# Altium schematic sheet Main.SchDoc
size B; SheetNumber: 1; SheetTotal: 1
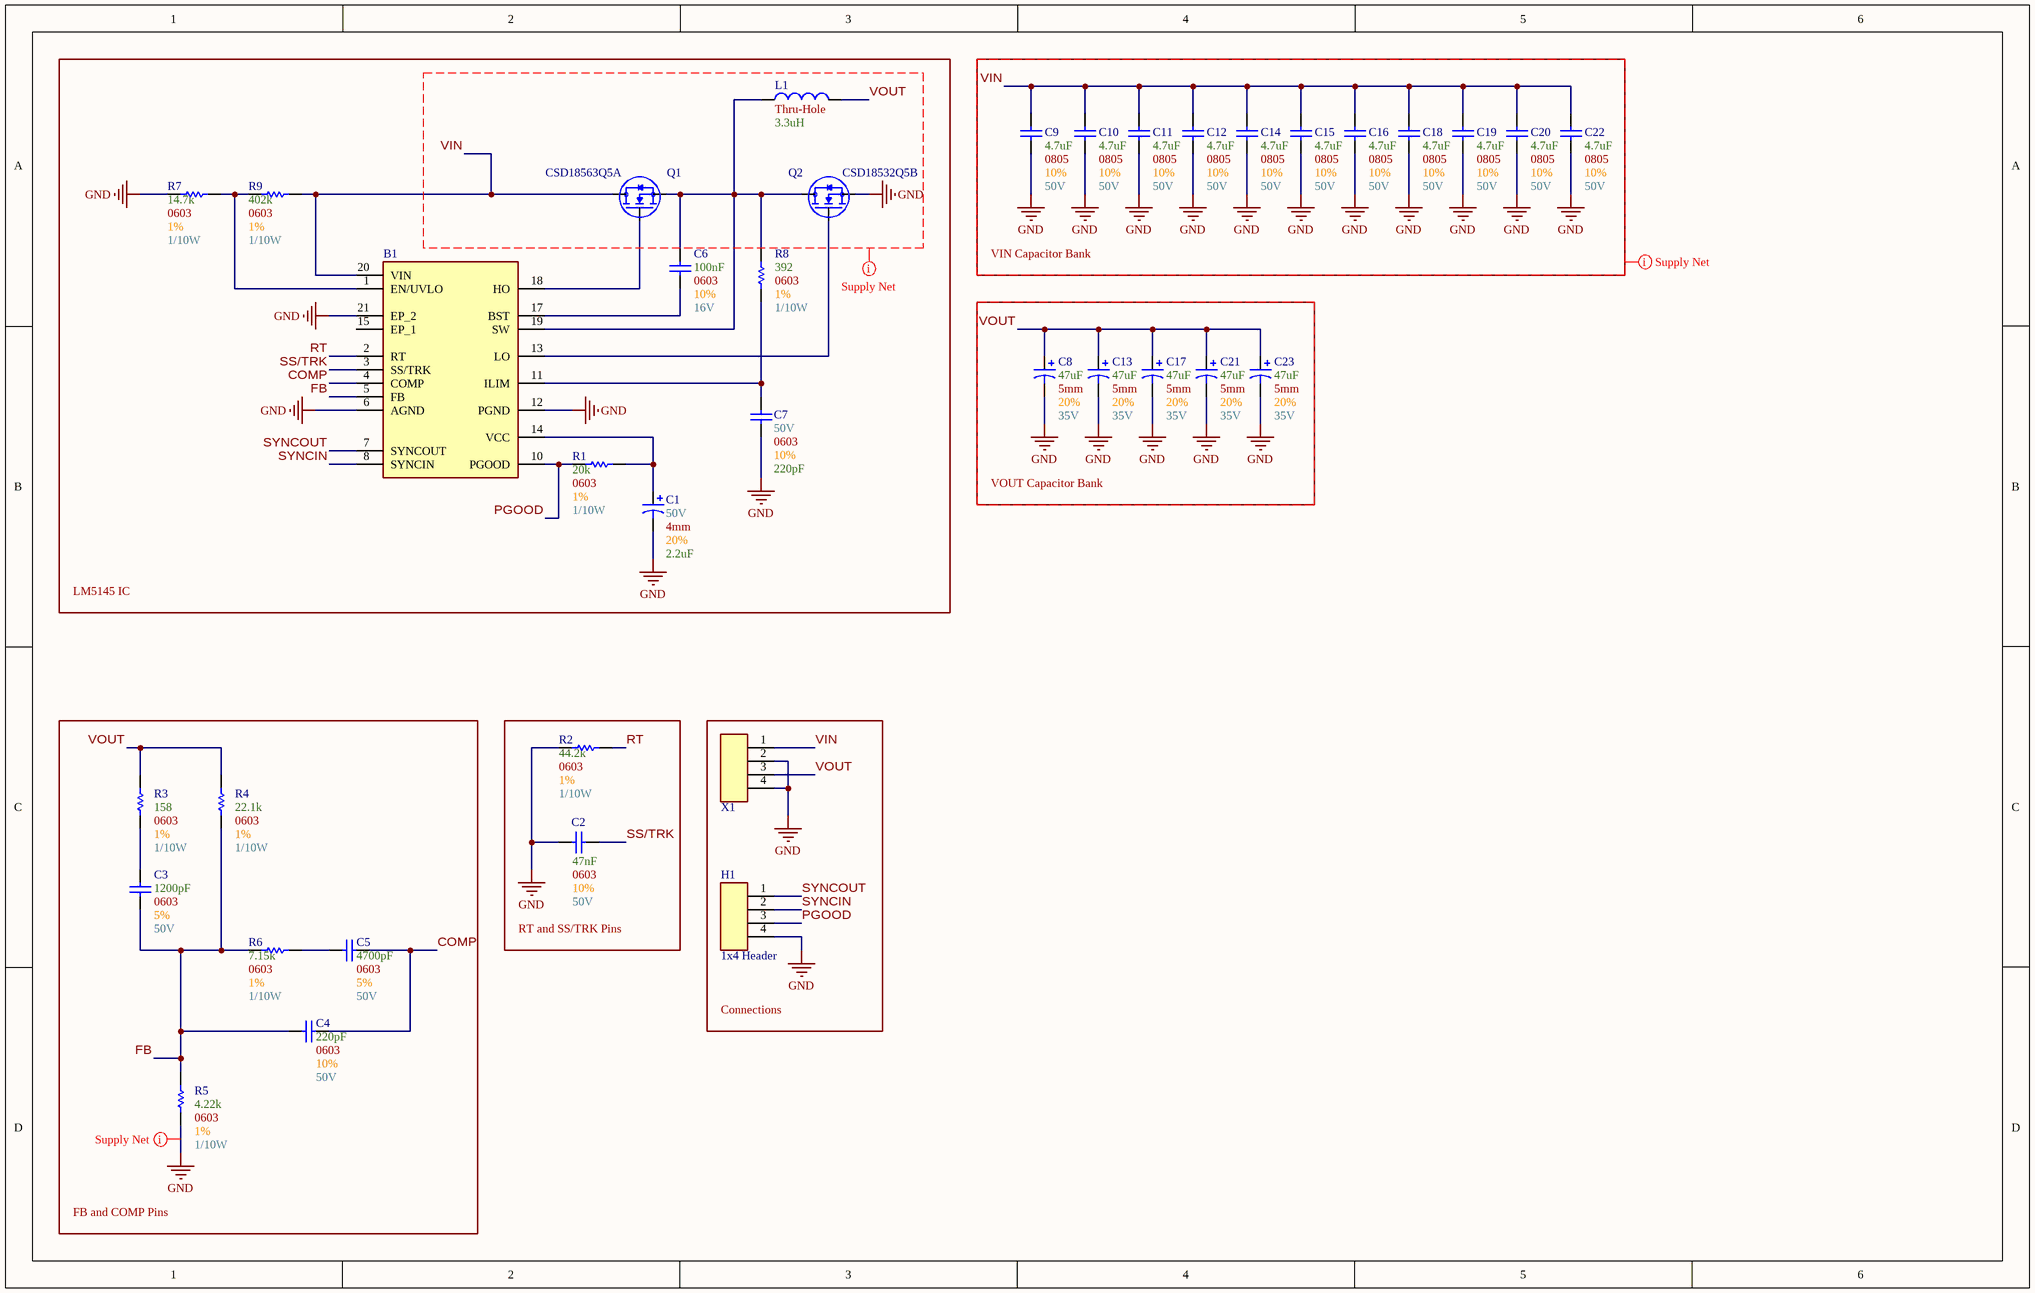
[diagram p0: Main.SchDoc]

## Parts
B1  [Buck Controller] 6-75V Buck Controller  [[Buck Controller] 6-75V Buck Controller]  (value not drawn)
C1  Max Voltage: 50V  Size Package: 4mm  Tolerance: 20%  Capacitance: 2.2uF  [[Cap] SMD Polarized, 4mm]  (hidden comment: [Cap] 4mm 2.2uF 20% 50V)
C2  Max Voltage: 50V  Size Package: 0603  Tolerance: 10%  Capacitance: 47nF  [[Cap] SMD 0603]  (hidden comment: [Cap] 0603 47nF 10% 50V)
C3  Max Voltage: 50V  Size Package: 0603  Tolerance: 5%  Capacitance: 1200pF  [[Cap] SMD 0603]  (hidden comment: [Cap] 0603 1200pF 5% 50V)
C4  Max Voltage: 50V  Size Package: 0603  Tolerance: 10%  Capacitance: 220pF  [[Cap] SMD 0603]  (hidden comment: [Cap] 0603 220pF 10% 50V)
C5  Max Voltage: 50V  Size Package: 0603  Tolerance: 5%  Capacitance: 4700pF  [[Cap] SMD 0603]  (hidden comment: [Cap] 0603 4700pF 5% 50V)
C6  Max Voltage: 16V  Size Package: 0603  Tolerance: 10%  Capacitance: 100nF  [[Cap] SMD 0603]  (hidden comment: [Cap] 0603 0.1uF 10% 16V)
C7  Max Voltage: 50V  Size Package: 0603  Tolerance: 10%  Capacitance: 220pF  [[Cap] SMD 0603]  (hidden comment: [Cap] 0603 12pF 5% 50V)
C8  Max Voltage: 35V  Size Package: 5mm  Tolerance: 20%  Capacitance: 47uF  [[Cap] SMD Polarized, 5mm]  (hidden comment: [Cap] 5mm 47uF 20% 35V)
C9  Max Voltage: 50V  Size Package: 0805  Tolerance: 10%  Capacitance: 4.7uF  [[Cap] SMD 0805]  (hidden comment: [Cap] 0805 4.7uF 10% 50V)
C10  Max Voltage: 50V  Size Package: 0805  Tolerance: 10%  Capacitance: 4.7uF  [[Cap] SMD 0805]  (hidden comment: [Cap] 0805 4.7uF 10% 50V)
C11  Max Voltage: 50V  Size Package: 0805  Tolerance: 10%  Capacitance: 4.7uF  [[Cap] SMD 0805]  (hidden comment: [Cap] 0805 4.7uF 10% 50V)
C12  Max Voltage: 50V  Size Package: 0805  Tolerance: 10%  Capacitance: 4.7uF  [[Cap] SMD 0805]  (hidden comment: [Cap] 0805 4.7uF 10% 50V)
C13  Max Voltage: 35V  Size Package: 5mm  Tolerance: 20%  Capacitance: 47uF  [[Cap] SMD Polarized, 5mm]  (hidden comment: [Cap] 5mm 47uF 20% 35V)
C14  Max Voltage: 50V  Size Package: 0805  Tolerance: 10%  Capacitance: 4.7uF  [[Cap] SMD 0805]  (hidden comment: [Cap] 0805 4.7uF 10% 50V)
C15  Max Voltage: 50V  Size Package: 0805  Tolerance: 10%  Capacitance: 4.7uF  [[Cap] SMD 0805]  (hidden comment: [Cap] 0805 4.7uF 10% 50V)
C16  Max Voltage: 50V  Size Package: 0805  Tolerance: 10%  Capacitance: 4.7uF  [[Cap] SMD 0805]  (hidden comment: [Cap] 0805 4.7uF 10% 50V)
C17  Max Voltage: 35V  Size Package: 5mm  Tolerance: 20%  Capacitance: 47uF  [[Cap] SMD Polarized, 5mm]  (hidden comment: [Cap] 5mm 47uF 20% 35V)
C18  Max Voltage: 50V  Size Package: 0805  Tolerance: 10%  Capacitance: 4.7uF  [[Cap] SMD 0805]  (hidden comment: [Cap] 0805 4.7uF 10% 50V)
C19  Max Voltage: 50V  Size Package: 0805  Tolerance: 10%  Capacitance: 4.7uF  [[Cap] SMD 0805]  (hidden comment: [Cap] 0805 4.7uF 10% 50V)
C20  Max Voltage: 50V  Size Package: 0805  Tolerance: 10%  Capacitance: 4.7uF  [[Cap] SMD 0805]  (hidden comment: [Cap] 0805 4.7uF 10% 50V)
C21  Max Voltage: 35V  Size Package: 5mm  Tolerance: 20%  Capacitance: 47uF  [[Cap] SMD Polarized, 5mm]  (hidden comment: [Cap] 5mm 47uF 20% 35V)
C22  Max Voltage: 50V  Size Package: 0805  Tolerance: 10%  Capacitance: 4.7uF  [[Cap] SMD 0805]  (hidden comment: [Cap] 0805 4.7uF 10% 50V)
C23  Max Voltage: 35V  Size Package: 5mm  Tolerance: 20%  Capacitance: 47uF  [[Cap] SMD Polarized, 5mm]  (hidden comment: [Cap] 5mm 47uF 20% 35V)
H1  1x4 Header  [[Header] 1x4 Male]
L1  Package: Thru-Hole  Inductance: 3.3uH  [[Inductor] 19.18mm Diameter]  (hidden comment: [3.3uH] Thru-Hole 40A 2.4mOhm)
Q1  CSD18563Q5A  [8-VSON]
Q2  CSD18532Q5B  [8-VSON]
R1  Wattage: 1/10W  Tolerance: 1%  Resistance: 20k  Size Package: 0603  [[Res] SMD 0603]  (hidden comment: [20k] SMD 0603 1% 1/10W)
R2  Wattage: 1/10W  Tolerance: 1%  Resistance: 44.2k  Size Package: 0603  [[Res] SMD 0603]  (hidden comment: [44.2k] SMD 0603 1% 1/10W)
R3  Wattage: 1/10W  Tolerance: 1%  Resistance: 158  Size Package: 0603  [[Res] SMD 0603]  (hidden comment: [158] SMD 0603 1% 1/10W)
R4  Wattage: 1/10W  Tolerance: 1%  Resistance: 22.1k  Size Package: 0603  [[Res] SMD 0603]  (hidden comment: [22.1k] SMD 0603 1% 1/10W)
R5  Wattage: 1/10W  Tolerance: 1%  Resistance: 4.22k  Size Package: 0603  [[Res] SMD 0603]  (hidden comment: [4.22k] SMD 0603 1% 1/10W)
R6  Wattage: 1/10W  Tolerance: 1%  Resistance: 7.15k  Size Package: 0603  [[Res] SMD 0603]  (hidden comment: [7.15k] SMD 0603 1% 1/10W)
R7  Wattage: 1/10W  Tolerance: 1%  Resistance: 14.7k  Size Package: 0603  [[Res] SMD 0603]  (hidden comment: [14.7k] SMD 0603 1% 1/10W)
R8  Wattage: 1/10W  Tolerance: 1%  Resistance: 392  Size Package: 0603  [[Res] SMD 0603]  (hidden comment: [392] SMD 0603 1% 1/10W)
R9  Wattage: 1/10W  Tolerance: 1%  Resistance: 402k  Size Package: 0603  [[Res] SMD 0603]  (hidden comment: [402k] SMD 0603 1% 1/10W)
X1  4pin Screw Terminal  [[Screw Terminal] 4pin 5mm]  (value not drawn)

## Blocks framed on the sheet
LM5145 IC: B1 C1 C6 C7 L1 Q1 Q2 R1 R7-R9
VIN Capacitor Bank: C9-C12 C14-C16 C18-C20 C22
VOUT Capacitor Bank: C8 C13 C17 C21 C23
FB and COMP Pins: C3-C5 R3-R6
RT and SS/TRK Pins: C2 R2
Connections: H1 X1

## Nets
GND: B1.6(AGND) B1.12(PGND) B1.21(EP_2) C1.2 C2.1 C7.1 C8.2 C9.1 C10.1 C11.1 C12.1 C13.2 C14.1 C15.1 C16.1 C17.2 C18.1 C19.1 C20.1 C21.2 C22.1 C23.2 H1.4 Q2.1(Source) R2.1 R5.1 R7.2 X1.2 X1.4
COMP: B1.4(COMP) C4.2 C5.2
FB: B1.5(FB) C3.1 C4.1 R4.1 R5.2 R6.1
PGOOD: B1.10(PGOOD) H1.3 R1.2
RT: B1.2(RT) R2.2
SS/TRK: B1.3(SS/TRK) C2.2
SYNCIN: B1.8(SYNCIN) H1.2
SYNCOUT: B1.7(SYNCOUT) H1.1
VIN: B1.20(VIN) C9.2 C10.2 C11.2 C12.2 C14.2 C15.2 C16.2 C18.2 C19.2 C20.2 C22.2 Q1.3(Drain) R9.2 X1.1
VOUT: C8.1 C13.1 C17.1 C21.1 C23.1 L1.2 R3.2 R4.2 X1.3
NetB1_1: B1.1(EN/UVLO) R7.1 R9.1
NetB1_11: B1.11(ILIM) C7.2 R8.2
NetB1_13: B1.13(LO) Q2.2(Gate)
NetB1_14: B1.14(VCC) C1.1 R1.1
NetB1_17: B1.17(BST) C6.1
NetB1_18: B1.18(HO) Q1.2(Gate)
NetB1_19: B1.19(SW) C6.2 L1.1 Q1.1(Source) Q2.3(Drain) R8.1
NetC3_2: C3.2 R3.1
NetC5_1: C5.1 R6.2

Not connected (* = marked no-connect by the designer): B1 15(EP_1)

## Layout directives
net class Supply_Nets: GND, VIN, VOUT

## Library data of the parts
B1 = [Buck Controller] 6-75V Buck Controller: LM5145RGYR; Supplier 1: DigiKey; Supplier Part Number 1: 296-47661-1-ND
C1 = [Cap] 4mm 2.2uF 20% 50V: EEE-HB1H2R2R; Supplier 1: Mouser; Supplier Part Number 1: 667-EEE-HB1H2R2R
C2 = [Cap] 0603 47nF 10% 50V: C0603C221K5RACTU; Supplier 1: DigiKey; Supplier Part Number 1: 1276-1063-1-ND
C3 = [Cap] 0603 1200pF 5% 50V: GRM1885C1H122JA01D; Supplier 1: DigiKey; Supplier Part Number 1: 490-1453-1-ND
C4 = [Cap] 0603 220pF 10% 50V: C0603C221K5RACTU; Supplier 1: DigiKey; Supplier Part Number 1: 399-C0603C221K5RACTUCT-ND
C5 = [Cap] 0603 4700pF 5% 50V: GRM1885C1H472JA01D; Supplier 1: DigiKey; Supplier Part Number 1: 490-9669-6-ND
C6 = [Cap] 0603 0.1uF 10% 16V: CC0603KRX7R7BB104; Supplier 1: DigiKey; Supplier Part Number 1: 311-1088-6-ND
C7 = [Cap] 0603 12pF 5% 50V: C0603C120J5GACTU; Supplier 1: DigiKey; Supplier Part Number 1: 399-C0603C120J5GACTUCT-ND
C8 C13 C17 C21 C23 = [Cap] 5mm 47uF 20% 35V: UCM1V470MCL1GS; Supplier 1: DigiKey; Supplier Part Number 1: 493-14540-1-ND
C9-C12 C14-C16 C18-C20 C22 = [Cap] 0805 4.7uF 10% 50V: GRT21BR61H475KE13L; Supplier 1: DigiKey; Supplier Part Number 1: 490-12394-1-ND
H1 = [Header] 1x4 Male: 2.54mm pitch
L1 = [3.3uH] Thru-Hole 40A 2.4mOhm: IHTH0750IZEB3R3M5A; Supplier 1: DigiKey; Supplier Part Number 1: IHTH0750IZEB3R3M5A-ND
Q1 = [NMOS] SMD 60V 100A (A): Supplier 1: DigiKey; Supplier Part Number 1: 296-36511-1-ND
Q2 = [NMOS] SMD 60V 100A (B): Supplier 1: DigiKey; Supplier Part Number 1: 296-46414-1-ND
R1 = [20k] SMD 0603 1% 1/10W: RC0603FR-0720KL; Supplier 1: DigiKey; Supplier Part Number 1: 311-20.0KHRCT-ND
R2 = [44.2k] SMD 0603 1% 1/10W: RC0603FR-0744K2L; Supplier 1: DigiKey; Supplier Part Number 1: 311-44.2KHRCT-ND
R3 = [158] SMD 0603 1% 1/10W: RC0603FR-07158RL; Supplier 1: DigiKey; Supplier Part Number 1: 311-158HRCT-ND
R4 = [22.1k] SMD 0603 1% 1/10W: RC0603FR-0722K1L; Supplier 1: DigiKey; Supplier Part Number 1: 311-22.1KHRCT-ND
R5 = [4.22k] SMD 0603 1% 1/10W: RMCF0603FT4K22; Supplier 1: DigiKey; Supplier Part Number 1: RMCF0603FT4K22CT-ND
R6 = [7.15k] SMD 0603 1% 1/10W: RMCF0603FT7K15; Supplier 1: DigiKey; Supplier Part Number 1: RMCF0603FT7K15CT-ND
R7 = [14.7k] SMD 0603 1% 1/10W: RMCF0603FT14K7; Supplier 1: DigiKey; Supplier Part Number 1: RMCF0603FT14K7CT-ND
R8 = [392] SMD 0603 1% 1/10W: RC0603FR-07392RL; Supplier 1: DigiKey; Supplier Part Number 1: 311-392HRCT-ND
R9 = [402k] SMD 0603 1% 1/10W: RC0603FR-07402KL; Supplier 1: DigiKey; Supplier Part Number 1: 311-402KHRCT-ND
X1 = [Screw Terminal] 4pin: TB002-500-04BE; Supplier 1: DigiKey; Supplier Part Number 1: 102-6147-ND